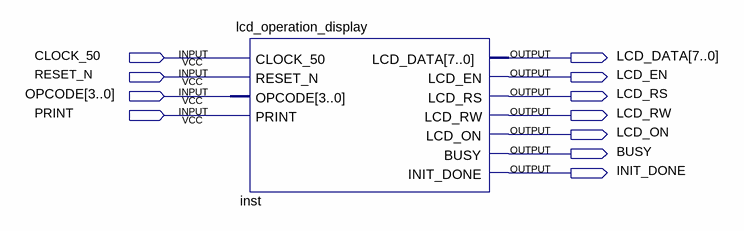
[diagram p0: schematic sheet]
// Quartus schematic lcd_example_top.bdf as structural Verilog: 1 symbols, 11 pins
module lcd_example_top (
  input  CLOCK_50,
  input  RESET_N,
  input  [3:0] OPCODE,
  input  PRINT,
  output [7:0] LCD_DATA,
  output LCD_EN,
  output LCD_RS,
  output LCD_RW,
  output LCD_ON,
  output BUSY,
  output INIT_DONE
);

  lcd_operation_display inst (
    .CLOCK_50(CLOCK_50), .RESET_N(RESET_N), .OPCODE(OPCODE), .PRINT(PRINT), .LCD_DATA(LCD_DATA),
    .LCD_EN(LCD_EN), .LCD_RS(LCD_RS), .LCD_RW(LCD_RW), .LCD_ON(LCD_ON), .BUSY(BUSY), .INIT_DONE(INIT_DONE));
endmodule
